# Altium schematic sheet I2C SENSORS & POWER MONITOR.SchDoc
size A; SheetNumber: 8; SheetTotal: 9
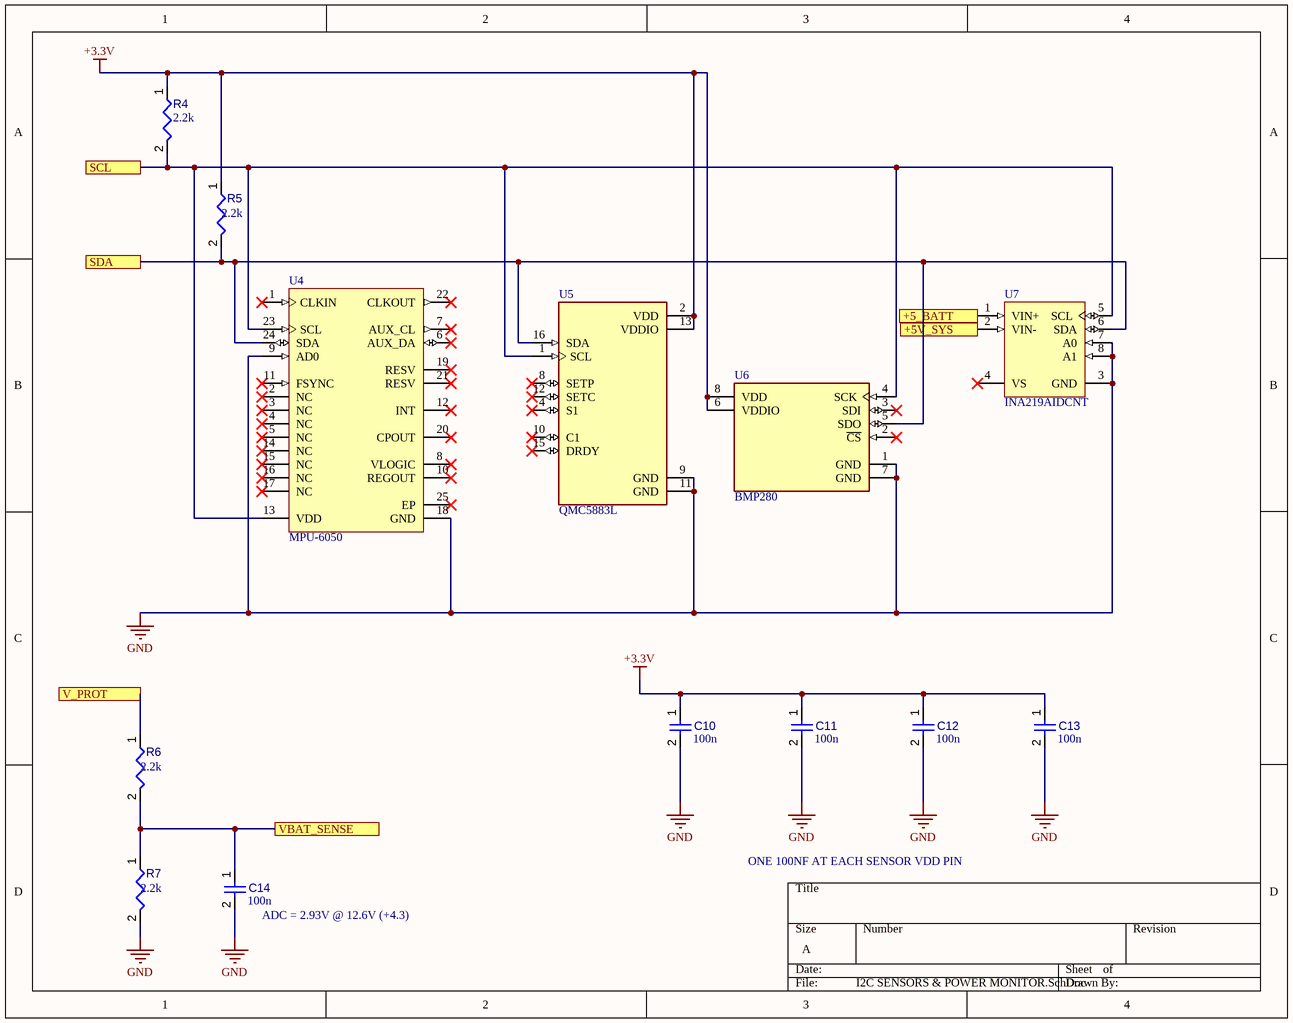
[diagram p0: I2C SENSORS & POWER MONITOR.SchDoc]

## Parts
C10  value 100n  [CAPC1608X90X40NL10T20]  (hidden comment: Capacitor 100 nF +/-10% 50 V 0603)
C11  value 100n  [CAPC1608X90X40NL10T20]  (hidden comment: Capacitor 100 nF +/-10% 50 V 0603)
C12  value 100n  [CAPC1608X90X40NL10T20]  (hidden comment: Capacitor 100 nF +/-10% 50 V 0603)
C13  value 100n  [CAPC1608X90X40NL10T20]  (hidden comment: Capacitor 100 nF +/-10% 50 V 0603)
C14  value 100n  [CAPC1608X90X40NL10T20]  (hidden comment: Capacitor 100 nF +/-10% 50 V 0603)
R4  100R2F  [RESC0402(1005)_L]  (value not drawn)
R5  100R2F  [RESC0402(1005)_L]  (value not drawn)
R6  100R2F  [RESC0402(1005)_L]  (value not drawn)
R7  100R2F  [RESC0402(1005)_L]  (value not drawn)
U4  MPU-6050  [IS-QFN-24_V]
U5  QMC5883L  [XDCR_HMC5883L-TR]
U6  BMP280  [FP-BMP280-MFG]
U7  INA219AIDCNT  [DCN0008A_L]

## Ports
+5_BATT, +5V_SYS, SCL, SDA, V_PROT, VBAT_SENSE

## Nets
+3.3V: C10.1 C11.1 C12.1 C13.1 R4.1 R5.1 U5.2(VDD) U5.13(VDDIO) U6.6(VDDIO) U6.8(VDD)
GND: C10.2 C11.2 C12.2 C13.2 C14.2 R7.2 U4.9(AD0) U4.18(GND) U5.9(GND) U5.11(GND) U6.1(GND) U6.7(GND) U7.3(GND) U7.7(A0) U7.8(A1)
+5_BATT: U7.1(VIN+) ; port +5_BATT
+5V_SYS: U7.2(VIN-) ; port +5V_SYS
SCL: R4.2 U4.13(VDD) U4.23(SCL) U5.1(SCL) U6.4(SCK) U7.5(SCL) ; port SCL
SDA: R5.2 U4.24(SDA) U5.16(SDA) U6.5(SDO) U7.6(SDA) ; port SDA
V_PROT: R6.1 ; port V_PROT
VBAT_SENSE: C14.1 R6.2 R7.1 ; port VBAT_SENSE

Not connected (* = marked no-connect by the designer): U4 1(CLKIN)* 2(NC)* 3(NC)* 4(NC)* 5(NC)* 6(AUX_DA)* 7(AUX_CL)* 8(VLOGIC)* 10(REGOUT)* 11(FSYNC)* 12(INT)* 14(NC)* 15(NC)* 16(NC)* 17(NC)* 19(RESV)* 20(CPOUT)* 21(RESV)* 22(CLKOUT)* 25(EP)*; U5 4(S1)* 8(SETP)* 10(C1)* 12(SETC)* 15(DRDY)*; U6 2(~{CS})* 3(SDI)*; U7 4(VS)*

## Notes on the sheet
- ONE 100NF AT EACH SENSOR VDD PIN
- (near C14) ADC = 2.93V @ 12.6V (+4.3)
- (in symbol CMP-009-00065-2) 2.2k

## Library data of the parts
C10-C14 = CMP-001-00017-6: Chip Capacitor, 100 nF, +/- 10%, 50 V, 0603 (1608 Metric); Voltage Rating: 50V; Capacitor Type: Ceramic; Tolerance: 10%; Mounting Technology: SM; Max Operating Temperature: 125°C; RoHS Compliant: True; Pins: 2; Case/Package: 0603; Min Operating Temperature: -55°C
R4-R7 = CMP-009-00065-2: 100R 0.063W 1% 0402 (1005 Metric)  SMD; Power: 63mW; Tolerance: 1%; Case/Package: 0402; Pins: 2; Mounting Technology: SMT
U4 = CMP-1753-00002-2: 3-Axis Gyroscope, Accelerometer and a Digital Motion Processor(TM) (DMP), 2.375 to 3.46 V, -40 to 85 degC, 24-Pin QFN, RoHS, Tape and Reel; Manufacturer: InvenSense; Featured Product: MPU-60506-Axis,IntegratedI²CSolution; Other Names: 1428-1007-2 / MPU6050; Sensor Type: MotionTracking; Online Catalog: MPU-6000™Series; Unit PriceUSD: Digital; Datasheet Version: Rev. 3.3, 05/2012; Category: Sensors,Transducers; Datasheet URL: http://datasheet.octopart.com/MPU-6050-InvenSense-datasheet-14421344.pdf; Family: Multifunction; Standard Package: 5,000; Manufacturer URL: http://www.invensense.com/; Output Type: Digital; Dynamic Catalog: MPU-6000™Series
U5 = CMP-031-00008-1: Board Mount Hall Effect / Magnetic Sensors Sensors, Transducers Magnetic - Hall Effect, Digital Switch, Linear, Compass (ICs) - IC COMPASS 3 AXIS I2C 16LCC SMD; MP: HMC5883LTR; MF: STMicroelectronics; Design Item ID: HMC5883L-TR; Check_prices: https://www.snapeda.com/parts/HMC5883LTR/STMicroelectronics/view-part/?ref=eda; Case/Package: LCC-16 STMicroelectronics; Value: *; Source: HMC5883L-TR.SchLib; SnapEDA_Link: https://www.snapeda.com/parts/HMC5883LTR/STMicroelectronics/view-part/?ref=snap; Component Type: Standard; Pins: 11
U6 = CMP-2000-05076-3: SENSOR PRESSURE ABS; Operating Pressure: 15.95PSI; Pressure Type: Absolute; Output Type: SPI; Max Pressure: 290.08PSI; Port Style: No Port; Case/Package: SMD/SMT; Lead Free: Lead Free; Termination: SMD/SMT; Min Operating Temperature: -40°C; Number of Pins: 8; Max Operating Temperature: 85°C
U7 = CMP-0704-00039-2: Zero-Drift, Bi-Directional Current / Power Monitor, 3 to 5.5 V, -40 to 125 degC, 8-pin SOT23 (DCN8), Green (RoHS & no Sb/Br); Manufacturer: Texas Instruments; Input Offset (+/-)(Max)(uV): 100; Common Mode Range(Max)(V): 26; Gain(V/V): 1, 0.5, 0.25, 0.125; Vs(Min)(V): 3; Vs(Max)(V): 5.5; Small-Signal Bandwidth(Typ)(MHz): 0.011; Rating: Catalog; SubFamily: Current Shunt Monitor; Common Mode Range(Min)(V): 0; Quiescent Current (+/-)(Typ)(mA): 0.7; Code_JEDEC: MO-178; DatasheetVersion: SBOS448F; ComponentLink3URL: http://www.ti.com/lit/ml/mpds099c/mpds099c.pdf; PackageReference: DCN0008A; Eco-Plan: Green (RoHS & no Sb/Br); PackageVersion: 4202106/D, 11/2009; PackageDescription: 8-Pin Plastic Small Outline, Body 1.6 x 2.9 mm, Pitch 0.65 mm; ComponentLink3Description: Package Specification; ComponentLink1Description: Manufacturer URL; ComponentLink1URL: http://www.ti.com/; CMRR(Min)(dB): 100; Mounting Technology: Surface Mount; ComponentLink2URL: http://www.ti.com/general/docs/lit/getliterature.tsp?genericPartNumber=INA219&fileType=pdf; PartNumber: INA219AIDCNT; ComponentLink2Description: Datasheet